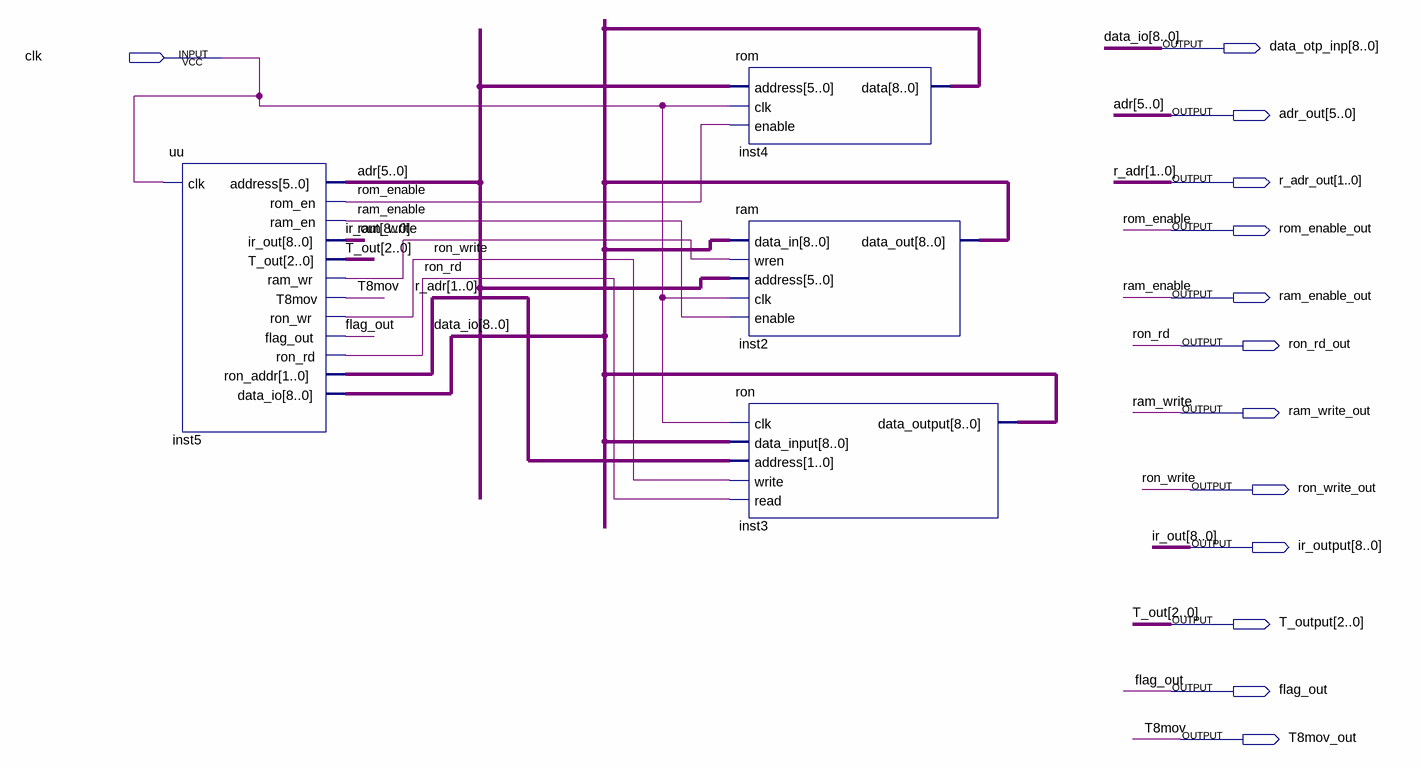
[diagram p0: schematic sheet]
// Quartus schematic laba4.bdf as structural Verilog: 4 symbols, 13 pins
module laba4 (
  input  clk,
  output [8:0] data_otp_inp,
  output [5:0] adr_out,
  output [1:0] r_adr_out,
  output rom_enable_out,
  output ram_enable_out,
  output ron_rd_out,
  output ram_write_out,
  output ron_write_out,
  output [8:0] ir_output,
  output [2:0] T_output,
  output flag_out,
  output T8mov_out
);

  uu inst5 (
    .clk(clk), .address(adr_out), .rom_en(rom_enable_out), .ram_en(ram_enable_out), .ir_out(ir_output),
    .T_out(T_output), .ram_wr(ram_write_out), .T8mov(T8mov_out), .ron_wr(ron_write_out), .flag_out(flag_out),
    .ron_rd(ron_rd_out), .ron_addr(r_adr_out), .data_io(data_otp_inp));
  rom inst4 (.address(adr_out), .clk(clk), .enable(rom_enable_out), .data(data_otp_inp));
  ram inst2 (
    .data_in(data_otp_inp), .wren(ram_write_out), .address(adr_out), .clk(clk), .enable(ram_enable_out),
    .data_out(data_otp_inp));
  ron inst3 (
    .clk(clk), .data_input(data_otp_inp), .address(r_adr_out), .write(ron_write_out), .read(ron_rd_out),
    .data_output(data_otp_inp));

  // Other names for the same wires on the sheet: adr[5:0] = adr_out; data_io[8:0] = data_otp_inp;
  //   ir_out[8:0] = ir_output; r_adr[1:0] = r_adr_out; ram_enable = ram_enable_out; ram_write = ram_write_out;
  //   rom_enable = rom_enable_out; ron_rd = ron_rd_out; ron_write = ron_write_out; T8mov = T8mov_out;
  //   T_out[2:0] = T_output
endmodule
